# Altium schematic sheet Load4.SchDoc
size A4; SheetNumber: 7; SheetTotal: 15
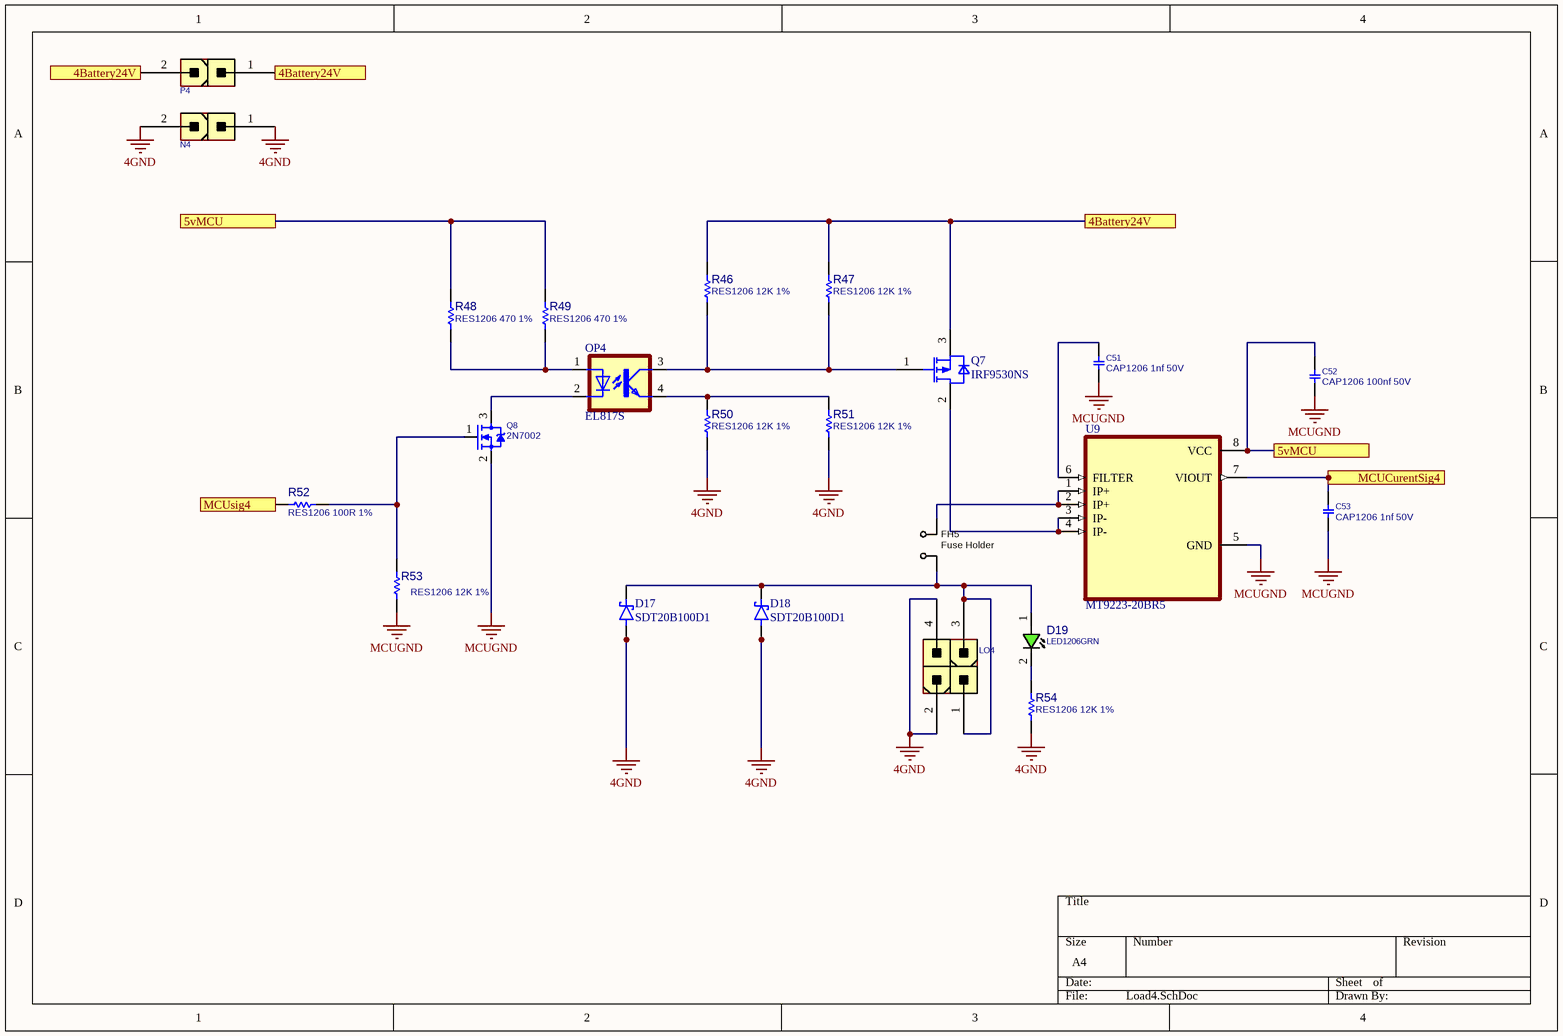
[diagram p0: Load4.SchDoc]

## Parts
C51  CAP1206 1nf 50V  [C1206]
C52  CAP1206 100nf 50V  [C1206]
C53  CAP1206 1nf 50V  [C1206]
D17  SDT20B100D1  [DPAK229P990X238-3N]
D18  SDT20B100D1  [DPAK229P990X238-3N]
D19  LED1206GRN  [LED1206GRN]
FH5  Fuse Holder  [FH_24101812]
LO4  CONN_ATXPWR_4  [ATXPWR_4]  (value not drawn)
N4  CONN_ATXPWR_2  [ATXPWR_2]  (value not drawn)
OP4  EL817S  [SOIC254P1030X460-4N]
P4  CONN_ATXPWR_2  [ATXPWR_2]  (value not drawn)
Q7  IRF9530NS  [TO254P1528X508-4_3N-V1]
Q8  2N7002  [SOT23_3]
R46  RES1206 12K 1%  [R1206]
R47  RES1206 12K 1%  [R1206]
R48  RES1206 470 1%  [R1206]
R49  RES1206 470 1%  [R1206]
R50  RES1206 12K 1%  [R1206]
R51  RES1206 12K 1%  [R1206]
R52  RES1206 100R 1%  [R1206]
R53  RES1206 12K 1%  [R1206]
R54  RES1206 12K 1%  [R1206]
U9  MT9223-20BR5  [SOIC127P600X175-8N]

## Ports
4Battery24V, 5vMCU, MCUCurentSig4, MCUsig4

## Nets
4GND: D17.1(A) D17.3(A__1) D18.1(A) D18.3(A__1) LO4.2 LO4.4 N4.1 N4.2 R50.2 R51.2 R54.2
MCUGND: C51.2 C52.2 C53.2 Q8.2(SOURCE) R53.2 U9.5(GND)
4Battery24V: P4.1 P4.2 Q7.3(SOURCE) R46.1 R47.1 ; port 4Battery24V
5vMCU: C52.1 R48.2 R49.2 U9.8(VCC) ; port 5vMCU
MCUCurentSig4: C53.1 U9.7(VIOUT) ; port MCUCurentSig4
MCUsig4: R52.1 ; port MCUsig4
NetC51_1: C51.1 U9.6(FILTER)
NetD17_4: D17.4(K) D18.4(K) D19.1(ANODE) FH5.1 LO4.1 LO4.3
NetD19_2: D19.2(CATHODE) R54.1
NetFH5_2: FH5.2 U9.1(IP+) U9.2(IP+)
NetOP4_1: OP4.1(A) R48.1 R49.1
NetOP4_2: OP4.2(C) Q8.3(DRAIN)
NetOP4_3: OP4.3(COL) Q7.1(GATE) R46.2 R47.2
NetOP4_4: OP4.4(EMIT) R50.1 R51.1
NetQ7_2: Q7.2(DRAIN) U9.3(IP-) U9.4(IP-)
NetQ8_1: Q8.1(GATE) R52.2 R53.1

## Library data of the parts
C51-C53 = CAP_SMD_MLCC_1206: CAP, MLCC; PARAM: -, -%; MANF_P#: MANF_PART#; PARAM2: -V; PRICE: 100= 1$; MANF: -; ASSEMBLY: ASSEMBLY
D17 D18 = MBRD835L: Diode Schottky 35 V 8A Surface Mount DPAK; MF: ON Semiconductor; SnapEDA_Link: https://www.snapeda.com/parts/MBRD835L/Onsemi/view-part/?ref=snap; Package: TO-252-3 MICROSS/On Semiconductor; Value: *; MP: MBRD835L; Check_prices: https://www.snapeda.com/parts/MBRD835L/Onsemi/view-part/?ref=eda
D19 = LED_SMD_1206_GRN: LED, SMD, 1206, GREEN; PARAM: 20mA; DESC: DESCRIPTION; PARAM2: 2.2V; MANF: -; ASSEMBLY: ASSEMBLY; PRICE: 36t@Javan; MANF_P#: -; VALUE: LED1206GRN; MountType: SMT; PartType: LED
FH5 = FUSE_SMD_HOLDER_24101812: Fuse SMD2410 Holder; PARAM: max. 10A; MANF: Littelfuse; MANF_P#: 01550900M; PARAM2: 125v; PRICE: 0.2$; PACKAGE: SMD,5.0x9.7mm; VALUE: Fuse Holder
LO4 = CONN_ATXPWR_4: CONN, ATX POWER, 4 P; MANF: TE, Molex; MANF_P#: 4-1775099-0, 39281043; VALUE: CONN_ATXPWR_4; MountType: THD; PACKAGE: ATXPWR-4pin; Part Type: Conn.
N4 P4 = CONN_ATXPWR_2: CONN, ATX POWER, 2 P; MANF: Molex; MANF_P#: 39281023; VALUE: CONN_ATXPWR_2; MountType: THD; PACKAGE: ATXPWR-2pin; Part Type: Conn.
OP4 = EL817S: Optoisolator Transistor Output 5000Vrms 1 Channel 4-SMD; MF: Everlight Electronics; SnapEDA_Link: https://www.snapeda.com/parts/EL817S/Everlight+Electronics+Co+Ltd/view-part/?ref=snap; Package: SMD-4 Everlight Electronics Co Ltd; Value: *; MP: EL817S; Check_prices: https://www.snapeda.com/parts/EL817S/Everlight+Electronics+Co+Ltd/view-part/?ref=eda
Q7 = IRF9530NS: OptiMOS - P2 Power-Transistor, P-channel-Enhancement mode, VDS -30V; Manufacturer: Infineon Technologies; Manufacturer Order NumberManufacturer Order Number: IRF9530NS; PackageReference: PG-TO263-3-901
Q8 = MOSN_2N7002_SOT23: MOSFET, N-CH, 60V, 0.3A; MANF: NXP; ASSEMBLY: ASSEMBLY; MANF_P#: 2N7002; PARAM2: 60v; PARAM: 0.3A; PRICE: 0.3t@Javan; VALUE: 2N7002
R46-R54 = RES_SMD_1206: RESISTOR, SMD; PARAM: 1%, 0.25W; DESC: DESCRIPTION; DIST#: MOUSER; MANF_P#: -; MANF: -; ASSEMBLY: ASSEMBLY; PRICE: -; PARAM2: -
U9 = ACS712ELCTR-05B-T: MF: {'manufacturer': u'Allegro MicroSystems'}; Package: None; Price: None; Value: *; MP: ACS712ELCTR-05B-T; Availability: Unavailable